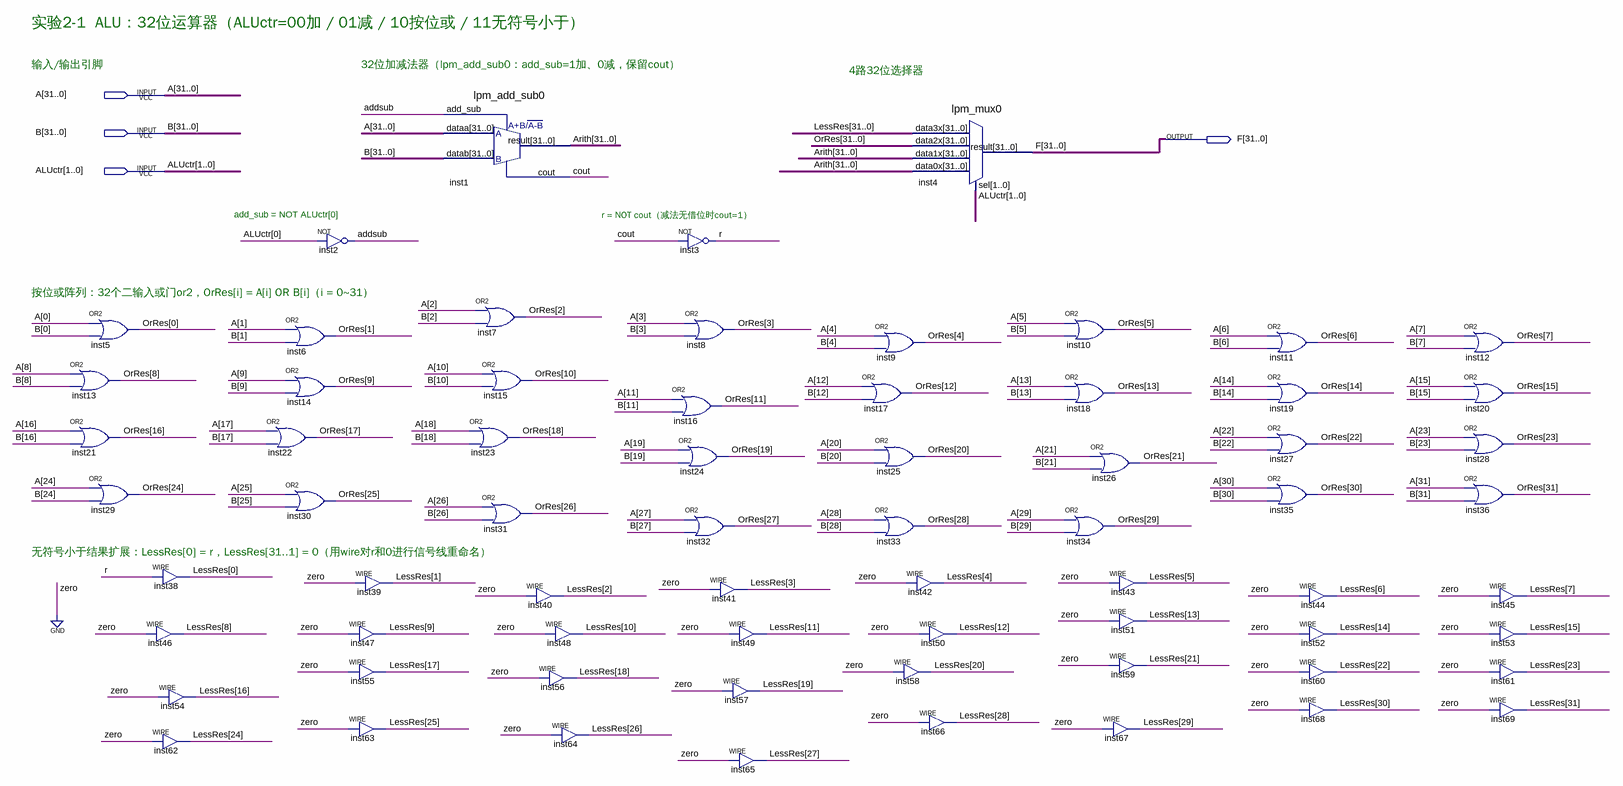
[diagram p0: schematic sheet]
// Quartus schematic ALU.bdf as structural Verilog: 68 symbols, 4 pins
module ALU (
  input  [31:0] A,
  input  [31:0] B,
  input  [1:0] ALUctr,
  output [31:0] F
);

  wire addsub, cout, r;
  wire [31:0] Arith, LessRes, OrRes;

  or inst13 (OrRes[8], A[8], B[8]);
  or inst21 (OrRes[16], A[16], B[16]);
  or inst5 (OrRes[0], A[0], B[0]);
  or inst29 (OrRes[24], A[24], B[24]);
  assign LessRes[0] = r;  // WIRE inst38
  assign LessRes[8] = 1'b0;  // WIRE inst46
  assign LessRes[16] = 1'b0;  // WIRE inst54
  assign LessRes[24] = 1'b0;  // WIRE inst62
  or inst22 (OrRes[17], A[17], B[17]);
  not inst2 (addsub, ALUctr[0]);
  or inst6 (OrRes[1], A[1], B[1]);
  or inst14 (OrRes[9], A[9], B[9]);
  or inst30 (OrRes[25], A[25], B[25]);
  assign LessRes[1] = 1'b0;  // WIRE inst39
  assign LessRes[9] = 1'b0;  // WIRE inst47
  assign LessRes[17] = 1'b0;  // WIRE inst55
  assign LessRes[25] = 1'b0;  // WIRE inst63
  lpm_add_sub0 inst1 (.dataa(A), .datab(B), .add_sub(addsub), .result(Arith), .cout(cout));
  or inst7 (OrRes[2], A[2], B[2]);
  or inst15 (OrRes[10], A[10], B[10]);
  or inst23 (OrRes[18], A[18], B[18]);
  or inst31 (OrRes[26], A[26], B[26]);
  assign LessRes[2] = 1'b0;  // WIRE inst40
  assign LessRes[10] = 1'b0;  // WIRE inst48
  assign LessRes[18] = 1'b0;  // WIRE inst56
  assign LessRes[26] = 1'b0;  // WIRE inst64
  not inst3 (r, cout);
  or inst8 (OrRes[3], A[3], B[3]);
  or inst16 (OrRes[11], A[11], B[11]);
  or inst24 (OrRes[19], A[19], B[19]);
  or inst32 (OrRes[27], A[27], B[27]);
  assign LessRes[3] = 1'b0;  // WIRE inst41
  assign LessRes[11] = 1'b0;  // WIRE inst49
  assign LessRes[19] = 1'b0;  // WIRE inst57
  assign LessRes[27] = 1'b0;  // WIRE inst65
  or inst9 (OrRes[4], A[4], B[4]);
  or inst17 (OrRes[12], A[12], B[12]);
  or inst25 (OrRes[20], A[20], B[20]);
  or inst33 (OrRes[28], A[28], B[28]);
  lpm_mux0 inst4 (.data3x(LessRes), .data2x(OrRes), .data1x(Arith), .data0x(Arith), .sel(ALUctr), .result(F));
  assign LessRes[4] = 1'b0;  // WIRE inst42
  assign LessRes[12] = 1'b0;  // WIRE inst50
  assign LessRes[20] = 1'b0;  // WIRE inst58
  assign LessRes[28] = 1'b0;  // WIRE inst66
  or inst10 (OrRes[5], A[5], B[5]);
  or inst18 (OrRes[13], A[13], B[13]);
  or inst26 (OrRes[21], A[21], B[21]);
  or inst34 (OrRes[29], A[29], B[29]);
  assign LessRes[5] = 1'b0;  // WIRE inst43
  assign LessRes[13] = 1'b0;  // WIRE inst51
  assign LessRes[21] = 1'b0;  // WIRE inst59
  assign LessRes[29] = 1'b0;  // WIRE inst67
  or inst11 (OrRes[6], A[6], B[6]);
  or inst19 (OrRes[14], A[14], B[14]);
  or inst27 (OrRes[22], A[22], B[22]);
  or inst35 (OrRes[30], A[30], B[30]);
  assign LessRes[6] = 1'b0;  // WIRE inst44
  assign LessRes[14] = 1'b0;  // WIRE inst52
  assign LessRes[22] = 1'b0;  // WIRE inst60
  assign LessRes[30] = 1'b0;  // WIRE inst68
  or inst12 (OrRes[7], A[7], B[7]);
  or inst20 (OrRes[15], A[15], B[15]);
  or inst28 (OrRes[23], A[23], B[23]);
  or inst36 (OrRes[31], A[31], B[31]);
  assign LessRes[7] = 1'b0;  // WIRE inst45
  assign LessRes[15] = 1'b0;  // WIRE inst53
  assign LessRes[23] = 1'b0;  // WIRE inst61
  assign LessRes[31] = 1'b0;  // WIRE inst69

  // Notes on the sheet:
  //   实验2-1  ALU：32位运算器（ALUctr=00加 / 01减 / 10按位或 / 11无符号小于）
  //   输入/输出引脚
  //   32位加减法器（lpm_add_sub0：add_sub=1加、0减，保留cout）
  //   4路32位选择器
  //   add_sub = NOT ALUctr[0]
  //   r = NOT cout（减法无借位时cout=1）
  //   按位或阵列：32个二输入或门or2，OrRes[i] = A[i] OR B[i]（i = 0~31）
  //   无符号小于结果扩展：LessRes[0] = r，LessRes[31..1] = 0（用wire对r和0进行信号线重命名）
endmodule
